# EAGLE design source_eagle (EAGLE 9.6.2)
COMPANY: ADAFRUIT INDUSTRIES; DRAWN: KTOWN; REV: A
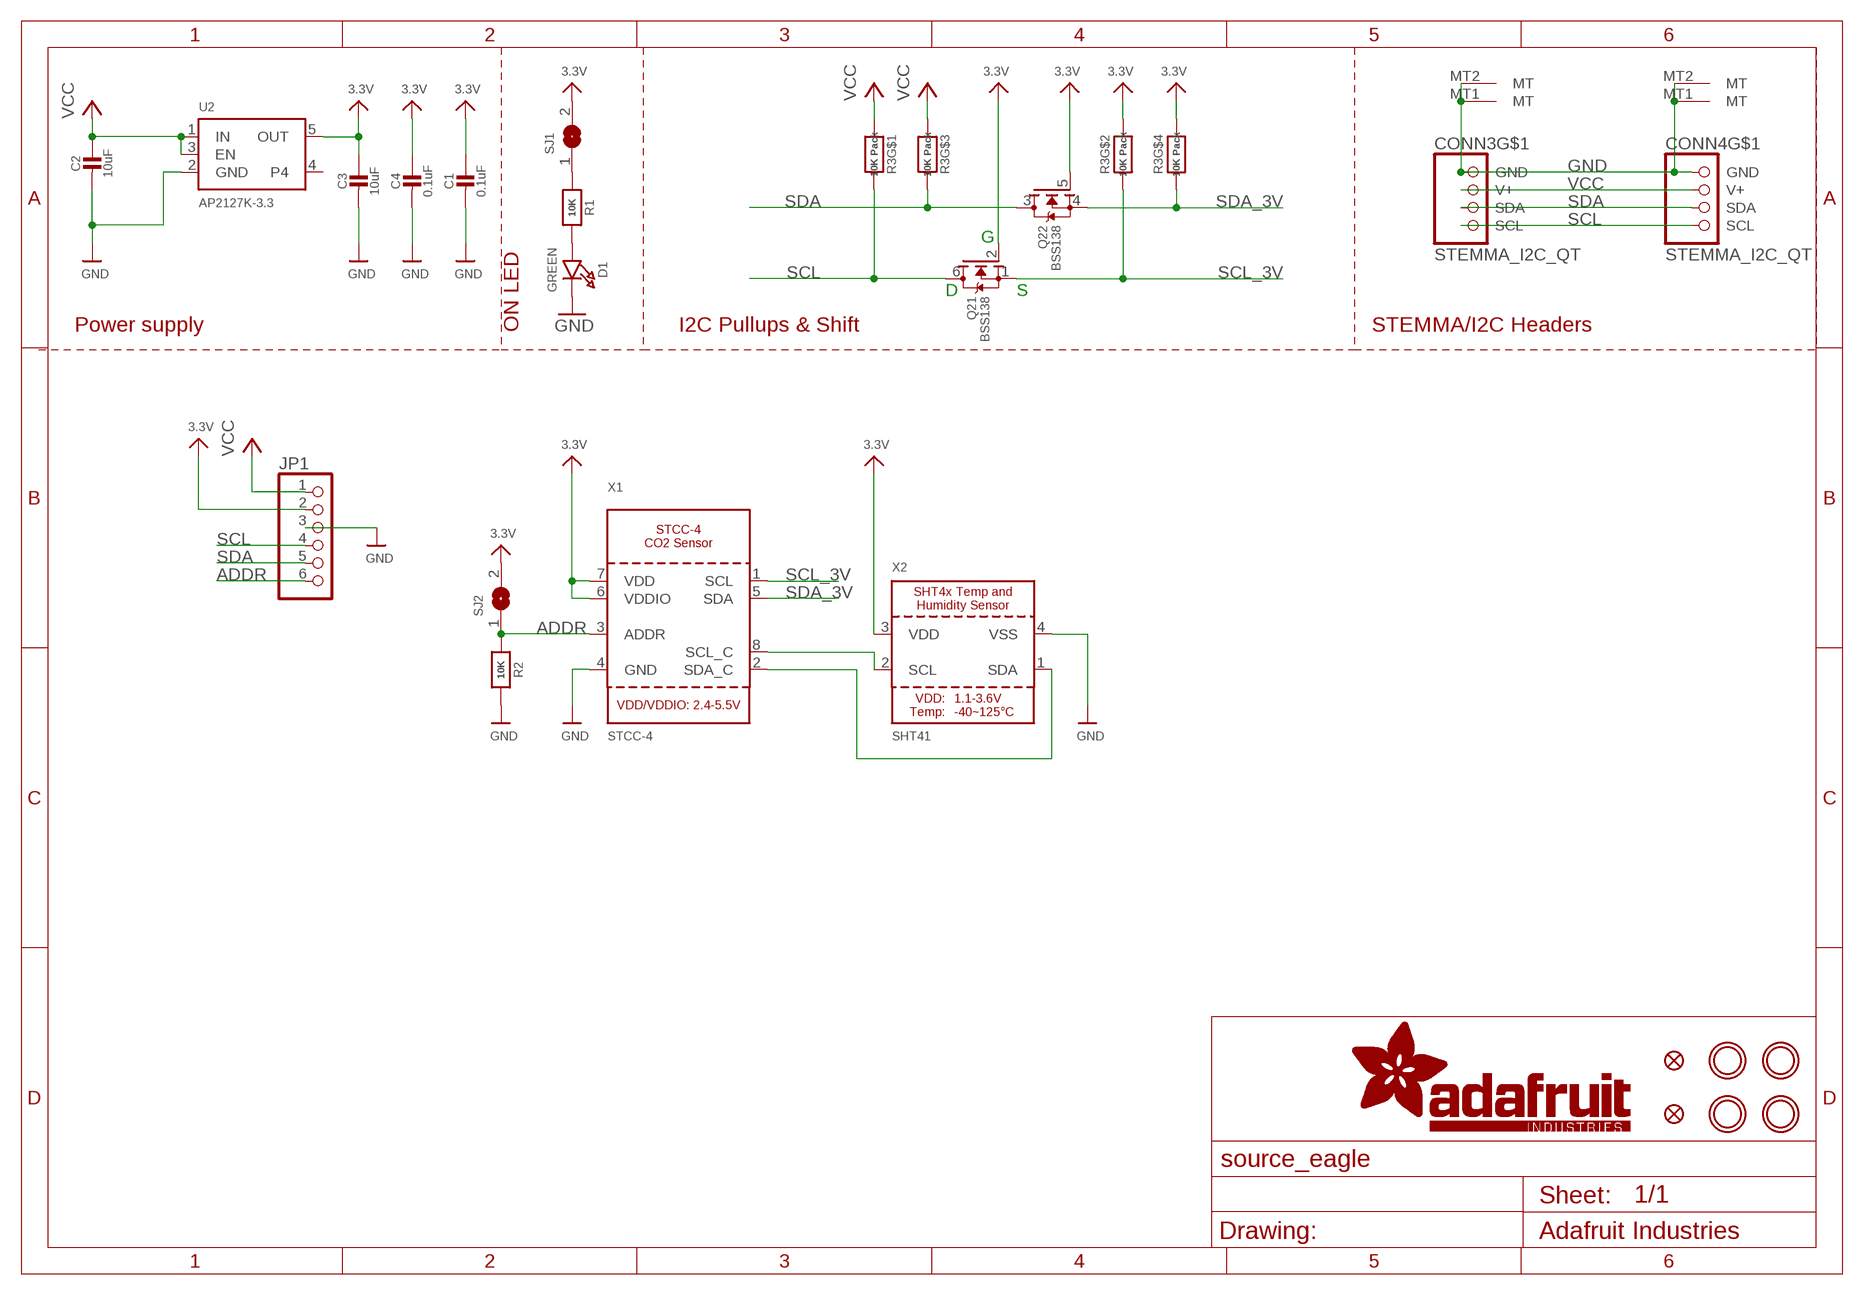
[diagram p0: schematic, sheet 1]

## Parts
C1  0.1uF  CAP_CERAMIC0603_NO  [0603-NO]
C2  10uF  CAP_CERAMIC0805-NOOUTLINE  [0805-NO]
C3  10uF  CAP_CERAMIC0805-NOOUTLINE  [0805-NO]
C4  0.1uF  CAP_CERAMIC0603_NO  [0603-NO]
CONN3  STEMMA_I2C_QT  [JST_SH4]
CONN4  STEMMA_I2C_QT  [JST_SH4]
D1  GREEN  LED0603_NOOUTLINE  [CHIPLED_0603_NOOUTLINE]
FID3  FIDUCIAL_0.5MM  [FIDUCIAL_0.5MM]
FID4  FIDUCIAL_0.5MM  [FIDUCIAL_0.5MM]
JP1  HEADER-1X670MIL  [1X06_ROUND_70]
Q2  BSS138  MOSFET-N_DUAL  [SOT363]
R1  10K  RESISTOR_0603_NOOUT  [0603-NO]
R2  10K  RESISTOR_0603_NOOUT  [0603-NO]
R3  10K Pack  RESISTOR_4PACK  [RESPACK_4X0603]
SJ1  SOLDERJUMPERCLOSED  [SOLDERJUMPER_CLOSEDWIRE]
SJ2  SOLDERJUMPER  [SOLDERJUMPER_ARROW_NOPASTE]
U2  AP2127K-3.3  VREG_SOT23-5  [SOT23-5]
U$1  MOUNTINGHOLE2.5  [MOUNTINGHOLE_2.5_PLATED]
U$17  MOUNTINGHOLE2.5  [MOUNTINGHOLE_2.5_PLATED]
U$19  MOUNTINGHOLE2.5  [MOUNTINGHOLE_2.5_PLATED]
U$21  MOUNTINGHOLE2.5  [MOUNTINGHOLE_2.5_PLATED]
X1  STCC-4  [STCC4]
X2  SHT41  SHT4X_  [SHT4X]

## Nets
3.3V [lowpower]: C1.1 C3.1 C4.1 JP1.2 Q2.2(1:G) Q2.5(2:G) R3.2 R3.4 SJ1.2 SJ2.2 U2.5(OUT) X1.6(VDDIO) X1.7(VDD) X2.3(VDD)
ADDR: JP1.6 R2.1 SJ2.1 X1.3(ADDR)
GND [highpower]: C1.2 C2.2 C3.2 C4.2 CONN3.1(GND) CONN3.MT1(MT) CONN3.MT2(MT) CONN4.1(GND) CONN4.MT1(MT) CONN4.MT2(MT) D1.C JP1.3 R2.2 U2.2(GND) X1.4(GND) X2.4(VSS)
N$1: D1.A R1.2
N$2 [lowpower]: R1.1 SJ1.1
N$3: X1.8(SCL_C) X2.2(SCL)
N$4: X1.2(SDA_C) X2.1(SDA)
SCL: CONN3.4(SCL) CONN4.4(SCL) JP1.4 Q2.6(1:D) R3.8
SCL_3V: Q2.1(1:S) R3.7 X1.1(SCL)
SDA: CONN3.3(SDA) CONN4.3(SDA) JP1.5 Q2.3(2:D) R3.6
SDA_3V: Q2.4(2:S) R3.5 X1.5(SDA)
VCC [highpower]: C2.1 CONN3.2(V+) CONN4.2(V+) JP1.1 R3.1 R3.3 U2.1(IN) U2.3(EN)
Unconnected: U2.4

## Notes on the sheet
- G
- D | S
- Power supply | ON LED | I2C Pullups & Shift | STEMMA/I2C Headers

## Library data of the parts
C1-C4 = microbuilder:CAP_CERAMIC: Ceramic Capacitors For new designs, use the packages preceded by an '_' character since they are more reliable: The following footprints should be used on most boards: _0402 - Standard footprint for regular board layouts _0603 - Standard footprint for regular board layouts _0805 - Standard footprint for regular board layouts _1206 - Standard footprint for regular board layouts For extremely tight-pitch boards where space is at a premium, the following 'micro-pitch' footprints can be used (smaller pads, no silkscreen outline, etc.): _0402MP - Micro-pitch footprint for very dense/compact boards _0603MP - Micro-pitch footprint for very dense/compact boards _0805MP - Micro-pitch footprint for very dense/compact boards _1206MP - Micro-pitch footprint for very dense/compact boards
CONN3 CONN4 = adafruit_electromech:STEMMA_I2C; LCSC: C2845363
D1 = microbuilder:LED: LED 0603 - 0603 Surface Mount Package 2mA: Green LED - Low Power (3.9mcd, 2ma, 1.7Vf) - Digikey: 475-2709-2-ND Orange LED - Low Power (9.8mcd, 2ma, 1.8Vf) - Digikey: 475-1194-2-ND Red LED - Low Power (5mcd, 2ma, 1.8Vf) - Digikey: 475-1195-2-ND Yellow LED - Low Power (7mcd, 2ma, 1.8Vf) - Digikey: 475-1196-2-ND 5mA: Blue LED - Low Power (17mcd, 5ma, 2.9Vf) - Digikey: LNJ937W8CRACT-ND 0805 - 0805 Surface Mount Package 2mA: Red LED (8.8mcd, 2mA, 1.8Vf, Clear) - Low Power [Digikey: 475-2510-1-ND] Green LED (5mcd, 2mA, 1.8Vf, Clear) - Low Power [Digikey: 475-2730-1-ND] Yellow LED (11.3mcd, 2mA, 1.8Vf, Clear) - Low Power [Digikey: 475-2555-1-ND] 20mA: Red LED (104mcd, 20mA, Diffused) - LS R976 [Digikey: 475-1278-6-ND] Red LED (12mcd, 20mA, 2.0Vf, Clear) - APT2012EC [Digikey: 754-1128-1-ND] Green LED (15mcd, 20mA, 2.2Vf, Clear) - APT2012GC [Digikey: 754-1131-1-ND] Orange LED (160mcd, 20mA, 2.1Vf, Clear) - APT2012SECK [Digikey: 754-1130-1-ND] 1206 - 1206 Surface Mount Package Green LED (26mcd, 20mA, Diffused) - LG N971 [Digikey: 475-1407-6-ND] Red LED (15mcd, 20mA, Diffused) - LH N974 [Digikey: 475-1416-6-ND] Cree - Cree High-Power Surface Mount LEDs XPEBWT-L1-0000-00D50 - White 111lm 350mA 2.9Vf 6200K 110° XTEAWT-00-0000-00000LEE3 - White 114lm 350mA 2.85Vf 5000K 115° Everlight - Everlight 45-21 Series Surface Mount LEDs 45-21/QK2C-B2832AC2CB2/2T - Warm White 2000mcd 20mA 3.25Vf 3050K 120° 45-21/LK2C-B38452C4CB2/2T - Nuetral White 2000mcd 20mA 3.25Vf 4150K 120° 45-21/LK2C-B50634C6CB2/2T - Cold White 2200mcd 20mA 3.25Vf 5650K 120° PLCC2 Reverse Mount LS T77K-J1L2-1-0-2-R18-Z - Red 11.25mcd 2mA 1.8Vf 630nm 120° LO T77K-L1M2-24-Z - Orange 19.6mcd 2mA 1.8Vf 606nm 120° LY T77K-K2M1-26-Z - Yellow 15.7mcd 2mA 1.8Vf 587nm 120°; ROT: 270
FID3 FID4 = microbuilder:FIDUCIAL: Fiducial Alignment Points Various fiducial points for machine vision alignment.
JP1 = microbuilder:HEADER-1X6: PIN HEADER
Q2 = microbuilder:MOSFET-N_DUAL: Dual N-Channel MOSFET SOT363 (2.0x1.25mm) 2N7002PS - 60V, 320mA [Digikey: 568-5984-1-ND]; JLC_ROTATION: 270
R1 R2 = microbuilder:RESISTOR: Resistors For new designs, use the packages preceded by an '_' character since they are more reliable: The following footprints should be used on most boards: _0402 - Standard footprint for regular board layouts _0603 - Standard footprint for regular board layouts _0805 - Standard footprint for regular board layouts _1206 - Standard footprint for regular board layouts For extremely tight-pitch boards where space is at a premium, the following 'micro-pitch' footprints can be used (smaller pads, no silkscreen outline, etc.): _0402MP - Micro-pitch footprint for very dense/compact boards _0603MP - Micro-pitch footprint for very dense/compact boards _0805MP - Micro-pitch footprint for very dense/compact boards _1206MP - Micro-pitch footprint for very dense/compact boards
R3 = microbuilder:RESISTOR_4PACK: Resistor Packs (4 resistors) 4 x 0603 10K 1/16W - Digikey: YC164J-10KCT-ND
SJ1 = microbuilder:SOLDERJUMPER: SMD Solder JUMPER Solder the two pads together to create a connection, or remove the solder to break it. REFLOW - Use this footprint for solder paste and reflow ovens. WAVE - Use this footprint for hand-soldering (larger pads). CLOSED - Has a trace between the two pads to ensure it is closed by default. The trace needs to be cut to disable the jumper, and can be closed again by creating a solder bridge between the two pads.
SJ2 = microbuilder:SOLDERJUMPER: SMD Solder JUMPER Solder the two pads together to create a connection, or remove the solder to break it. REFLOW - Use this footprint for solder paste and reflow ovens. WAVE - Use this footprint for hand-soldering (larger pads). CLOSED - Has a trace between the two pads to ensure it is closed by default. The trace needs to be cut to disable the jumper, and can be closed again by creating a solder bridge between the two pads.; BOM: EXCLUDE
U2 = adafruit_power:VREG_SOT23-5: SOT23-5 Fixed Voltage Regulators Part Current Out V Out V In V Dropout θJA (°C/W) TJ (°C) Digikey Part No. ADP121 150mA 3.3V 3.4-5.5V 0.09V @ 150mA -- -- ADP121-AUJZ33R7CT-ND ADP121 150mA 3.0V 3.1-5.5V 0.09V @ 150mA -- -- ADP121-AUJZ30R7CT-ND ADP122 300mA 3.3V 3.4-5.5V 0.085V @ 300mA -- -- ADP122AUJZ-3.3-R7CT-ND ADP1712 300mA 3.3V 3.5-5.5V 0.17V @ 300mA -- -- ADP1712AUJZ-3.3-R7TR-ND AP7311 (Low Cost) 150mA 3.3V 3.5-6V 0.15V @ 150mA -- -- AP7311-33WG-7DICT-ND LD39015M18R 150mA 1.8V 1.9V-5.5V 0.08V @ 100mA -- -- 497-6977-1-ND LP2985A-33DBVR 150mA 3.3V 3.3-16V 0.28V @ 150mA 206 150 296-18479-1-ND MCP1824T-3302E/OT 300mA 3.3V 3.5V-6V 0.2V @ 300mA -- -- MCP1824T-3302E/OTCT-ND MIC5205-2.5YM5 TR 150mA 2.5V 2.7-16V 0.165V @ 150mA -- -- 576-1257-2-ND MIC5205-3.0YM5 TR 150mA 3.0V 3.2V-16V 0.165V @ 150mA -- -- 576-1258-2-ND MIC5205-3.3YM5 TR 150mA 3.3V 3.5V-16V 0.165V @ 150mA -- -- 576-1259-2-ND TPS780330220 150mA 3.3V+2.2V 3.6-5.5V 250mV Max -- -- 296-23332-1-ND TDA3663/N1,135 100mA 3.3V 3.5-45V 0.18V @ 50mA -- -- 568-5343-1-ND Max operating temp can be calculated using θJA, TJ (max junction temperature), and power in watts. Set the "Maximum Ambient Temperature" until it reaches TJ ("Max Junction Temperature"), which is the absolute limit for safe use of the regulator: Heat Sink Temperature Calculator For example, With 12V source into a 3.3V LP2985 and a 30mA load, we are dissipating (12V-3.3V) * 0.03A = 0.261W. With a θJA of 206 °C/W, a TJ of 150°C, and 261mW we can safely use the chip without a heat sink up to 75°C (=147.1°C Junction Temperature).; JLC_ROTATION: 270
U$1 U$17 U$19 U$21 = adafruit_electromech:MOUNTINGHOLE: Mounting Hole For #2 screws (0.086"/2.18mm width, 0.094"/2.4mm hole) use 2.5mm; BOM: EXCLUDE
X1 = adafruit_sensor:STCC-4
X2 = adafruit_sensor:SHT4X

## Net classes
1 highpower: width 0.305 mm, drill 0.483 mm
2 lowpower: width 0.254 mm, drill 0.483 mm

## Board
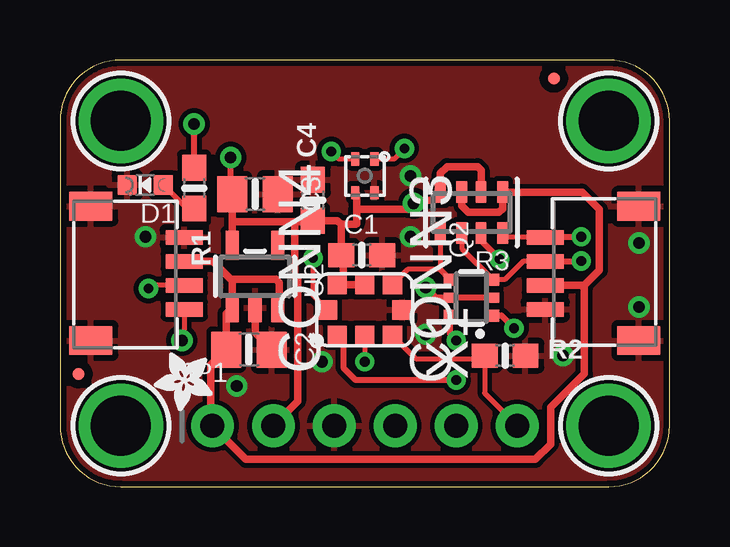
[diagram p1: board, top side]
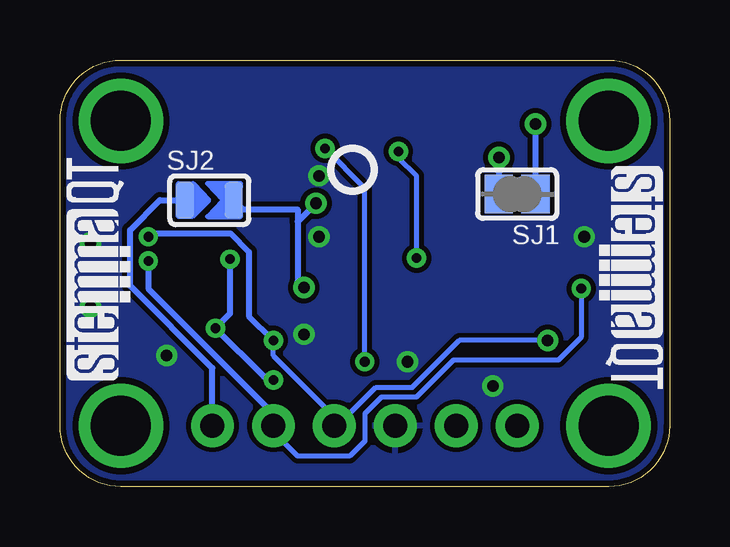
[diagram p2: board, bottom side, seen from below]

Size 25.4 x 17.78 mm. Coordinates in mm from the lower left corner, seen from the top.
Outline: 0,15.24 0,2.54 arc90 2.54,0 22.86,0 arc90 25.4,2.54 25.4,15.24 arc90 22.86,17.78 2.54,17.78 arc90 0,15.24
Copper layers (1*16): Top 0.035mm / dielectric 1.5mm / Bottom 0.035mm
Design rules "adafruit *": minimum track width 8mil, minimum drill 15.5mil, track to track 8mil, track to pad 8mil, pad to pad 8mil, via to via 8mil, smd to smd 8mil, copper to edge 10mil, drill to drill 8mil, minimum pad ring 10mil, minimum via ring 8mil, stop-mask expansion 2mil, vias tented up to drill 20mil, thermal gap 10mil

### Footprints (pad centres in the part's own frame; a part is rotated, then mirrored left to right if it is on the bottom)
0603-NO = smd 1.075 x 1: 1 -0.85,0; 2 0.85,0
0805-NO = smd 1.24 x 1.5: 1 -0.95,0; 2 0.95,0
JST_SH4 = smd 0.6 x 1.55: 1 -1.5,2.006; 2 -0.5,2.006; 3 0.5,2.006; 4 1.5,2.006 | smd 1.2 x 1.8: MT1 -2.8,-1.894; MT2 2.8,-1.894
CHIPLED_0603_NOOUTLINE = smd 0.8 x 0.8: A 0,-0.75; C 0,0.75
FIDUCIAL_0.5MM = smd 0.5 x 0.5: 1 0,0
1X06_ROUND_70 = drill 1 pad 1.778: 1 -6.35,0; 2 -3.81,0; 3 -1.27,0; 4 1.27,0; 5 3.81,0; 6 6.35,0
SOT363 = smd 0.5 x 0.5: 1 -0.75,-0.9; 3 0.75,-0.9; 4 0.75,0.9; 6 -0.75,0.9 | smd 0.4 x 0.5: 2 0,-0.9; 5 0,0.9
RESPACK_4X0603 = smd 0.45 x 0.9: 1 -1.3,-0.85; 2 -0.4,-0.85; 3 0.4,-0.85; 4 1.3,-0.85; 5 1.3,0.85; 6 0.4,0.85; 7 -0.4,0.85; 8 -1.3,0.85
SOLDERJUMPER_CLOSEDWIRE = smd 1.168 x 1.6: 1 -0.762,0; 2 0.762,0 | smd 0.635 x 0.203: WIRE 0,0
SOLDERJUMPER_ARROW_NOPASTE = smd 0.762 x 1.524: 1 -1.016,0; 2 1.016,0
SOT23-5 = smd 0.55 x 1.2: 1 -0.95,-1.3; 2 0,-1.3; 3 0.95,-1.3; 4 0.95,1.3; 5 -0.95,1.3
MOUNTINGHOLE_2.5_PLATED = drill 2.5 pad 3.2: P$1 0,0
STCC4 = smd 0.8 x 0.8: 1 -1.05,1.15; 2 -1.05,0; 3 -1.05,-1.15; 4 0,-1.55; 5 1.05,-1.15; 6 1.05,0; 7 1.05,1.15; 8 0,1.55
SHT4X = smd 0.55 x 0.35: 1 -0.7,0.4; 2 -0.7,-0.4; 3 0.7,-0.4; 4 0.7,0.4

### Placement (x,y rotation side)
C1  12.57,9.65 0 top
C2  7.87,5.71 0 top
C3  8.13,12.19 0 top
C4  10.54,11.94 90 top
CONN3  22.23,8.89 90 top
CONN4  3.17,8.89 270 top
D1  3.56,12.57 90 top
FID3  0.76,4.7 0 top
FID4  20.57,17.02 0 top
JP1  12.7,2.54 0 top
PLABEL0  [PLABEL0]  6.35,0.89 0 top
PLABEL1  [PLABEL1]  8.89,4.19 0 top
PLABEL2  [PLABEL2]  11.43,0.89 0 top
PLABEL3  [PLABEL3]  13.97,4.19 0 top
PLABEL4  [PLABEL4]  16.64,0.89 0 top
PLABEL5  [PLABEL5]  19.05,4.19 0 top
PLABEL6  [PLABEL6]  12.7,16.76 0 top
PLABEL7  [PLABEL7]  12.7,15.11 0 top
PLABEL8  [PLABEL8]  0.38,12.45 0 top
PLABEL9  [PLABEL9]  12.7,0.89 0 bottom
PLABEL10  [PLABEL10]  6.48,13.97 0 bottom
PLABEL11  [PLABEL11]  19.18,13.84 0 bottom
PLABEL12  [PLABEL12]  12.83,16.13 0 bottom
PLABEL13  [PLABEL13]  12.7,7.11 0 bottom
Q2  17.14,7.87 90 top
R1  5.59,12.45 270 top
R2  18.54,5.46 0 top
R3  17.14,11.43 180 top
SJ1  6.35,12.19 180 bottom
SJ2  19.18,11.94 0 bottom
U2  8.13,8.76 0 top
U$1  2.54,15.24 0 top
U$17  22.86,15.24 0 top
U$19  2.54,2.54 0 top
U$21  22.86,2.54 0 top
U$25  [PCBFEAT-REV-040]  13.21,13.21 0 bottom
U$28  [ADAFRUIT_2.5MM]  6.35,5.59 180 top
U$30  [STEMMAQT]  22.48,4.45 90 bottom
U$31  [STEMMAQT]  2.92,13.34 270 bottom
X1  12.7,7.37 90 top
X2  12.7,12.95 270 top

### Tracks (layer width: path | path; a pad name or v marks a point on that pad's centre or on a via)
3.3V  (via drill 0.48)
  Top 0.254: Q2.2 Q2.5 15.67,7.87 v15.24,8.3 | C3.1 7.11,12.26 v7.11,13.72 | 14.73,11.94 v14.73,11.81
  Top 0.305: X1.6 11.77,8.42 11.55,8.64 X1.7 11.8,8.67 11.8,9.57 C1.1 11.72,10.92 11.71,10.93 | X2.3 12.36,12.2 12.36,11.56 | 12.36,11.56 12.36,10.96 12.33,10.93 11.71,10.93 | C3.1 7.18,11.05 | 7.18,11.05 U2.5 | 7.18,11.05 9.78,11.05 | v14.73,11.81 14.48,11.56 12.36,11.56 | 14.73,11.94 15.5,11.94 R3.4 15.85,13.05 16.13,13.34 17.4,13.34 17.55,13.19 R3.2 | 9.78,11.05 9.78,8.76 9.91,8.64 9.91,3.56 JP1.2 | 11.71,10.93 11.56,11.09 C4.1 10.5,11.05 9.78,11.05
  Bottom 0.254: v7.11,13.72 SJ1.2 | v14.73,11.81 15.49,11.05 | v15.24,8.3 15.49,8.56 15.49,11.05 | SJ2.2 17.78,11.56 15.49,11.56 15.49,11.05
ADDR
  Top 0.203: X1.3 14.83,5.33 17.57,5.33 R2.1 17.69,3.9 JP1.6
  Bottom 0.254: JP1.6 19.05,4.94 22.48,8.37 22.48,10.69 21.23,11.94 SJ2.1
GND  (via drill 0.48)
  Top 0.305: U2.2 8.13,6.41 C2.2
  other vias: 3.56,10.41 15.24,6.35 14.61,10.41 14.61,12.95 24.13,7.49 24.13,10.16 20.95,5.46 10.92,5.21 7.37,4.19
  pour Top: 0,17.78 25.4,17.78 25.4,0 0,0
  pour Bottom: 0,17.78 25.4,17.78 25.4,0 0,0
N$1
  Top 0.203: D1.A 5.28,11.6 R1.2
N$2  (via drill 0.48)
  Top 0.254: R1.1 v5.59,15.11
  Bottom 0.254: v5.59,15.11 SJ1.1
N$3  (via drill 0.4)
  Top 0.203: v10.54,9.53 10.54,7.97 X1.8 | X2.2 11.62,13.65 v11.3,13.97
  Bottom 0.203: v10.54,9.53 10.54,12.95 11.3,13.72 v11.3,13.97
N$4  (via drill 0.4)
  Top 0.203: X1.2 v12.7,5.21 | v14.35,14.1 13.91,13.65 X2.1
  Bottom 0.203: v12.7,5.21 12.7,12.45 v14.35,14.1
SCL  (via drill 0.4, 0.48)
  Top 0.203: CONN3.4 19.94,10.39 18.64,10.39 R3.8 | CONN4.4 5.18,6.2 v5.08,6.1
  Top 0.254: Q2.6 16.25,6.36 v16.51,6.1 | v21.72,10.41 21.7,10.39 19.94,10.39
  Bottom 0.203: v5.08,6.1 8.76,6.1 10.72,4.14 12.24,4.14 13.84,2.54 JP1.4 13.97,2.92 16.51,5.46 v16.51,6.1
  Bottom 0.254: v16.51,6.1 17.53,7.11 17.53,9.78 18.29,10.54 21.59,10.54 v21.72,10.41
SCL_3V  (via drill 0.4)
  Top 0.254: v16.51,4.45 12.32,4.45 11.8,4.96 11.8,6.06 X1.1 | v18.92,6.6 18.4,7.12 Q2.1 | R3.7 17.55,10.25 v18.32,9.48
  Bottom 0.254: v16.51,4.45 16.64,4.57 16.89,4.57 v18.92,6.6 18.32,7.21 v18.32,9.48
SDA  (via drill 0.4)
  Top 0.203: R3.6 16.75,9.92 Q2.3 18.53,8.62 19.3,9.39 CONN3.3 | CONN4.3 3.82,8.39 v3.68,8.26
  Top 0.254: CONN3.3 20.23,9.4 v21.72,9.4
  Bottom 0.203: v3.68,8.26 3.68,6.22 4.64,5.27 9.01,5.27 10.55,3.73 12.01,3.73 12.7,3.05 12.7,1.91 13.34,1.27 15.49,1.27 16.51,2.29 JP1.5
  Bottom 0.254: v21.72,9.4 21.72,8.26 16.51,3.05 JP1.5
SDA_3V
  Top 0.203: X1.5 14.48,9.05 15.82,9.05 Q2.4 16.25,8.66 15.85,9.06 R3.5
VCC
  Top 0.305: 7.18,8.57 U2.1 6.92,7.21 C2.1 6.29,5.08 6.29,2.6 JP1.1 7.75,1.14 19.81,1.14 20.45,1.78 20.45,3.3 21.84,4.7 21.84,8.27 21.79,8.33 | 7.18,8.57 7.24,8.64 9.02,8.64 9.14,8.51 9.14,7.53 U2.3 | CONN4.2 6.36,9.39 7.18,8.57 | R3.3 16.75,11.7 17.02,11.43 18.29,11.43 18.45,11.59 R3.1 21.76,12.28 22.48,11.56 22.48,9.02 21.79,8.33 | CONN3.2 21.73,8.39 21.79,8.33

### Text on the board
Pinguin_tBackup: STCC4+SHT41 | CO2+Temp+Humidity | on | 3Vo | SCL | ADDR | VIN | GND | SDA
Pinguin_bBackup: STCC4+SHT41 | LED | Addr | 400~5000ppm CO2 / 0 to +70°C @ ±0.2°C / 10 to 90%RH @ ±1.8% / Default I2C addr 0x64 | VLogic/Vcc: 3-5VDC